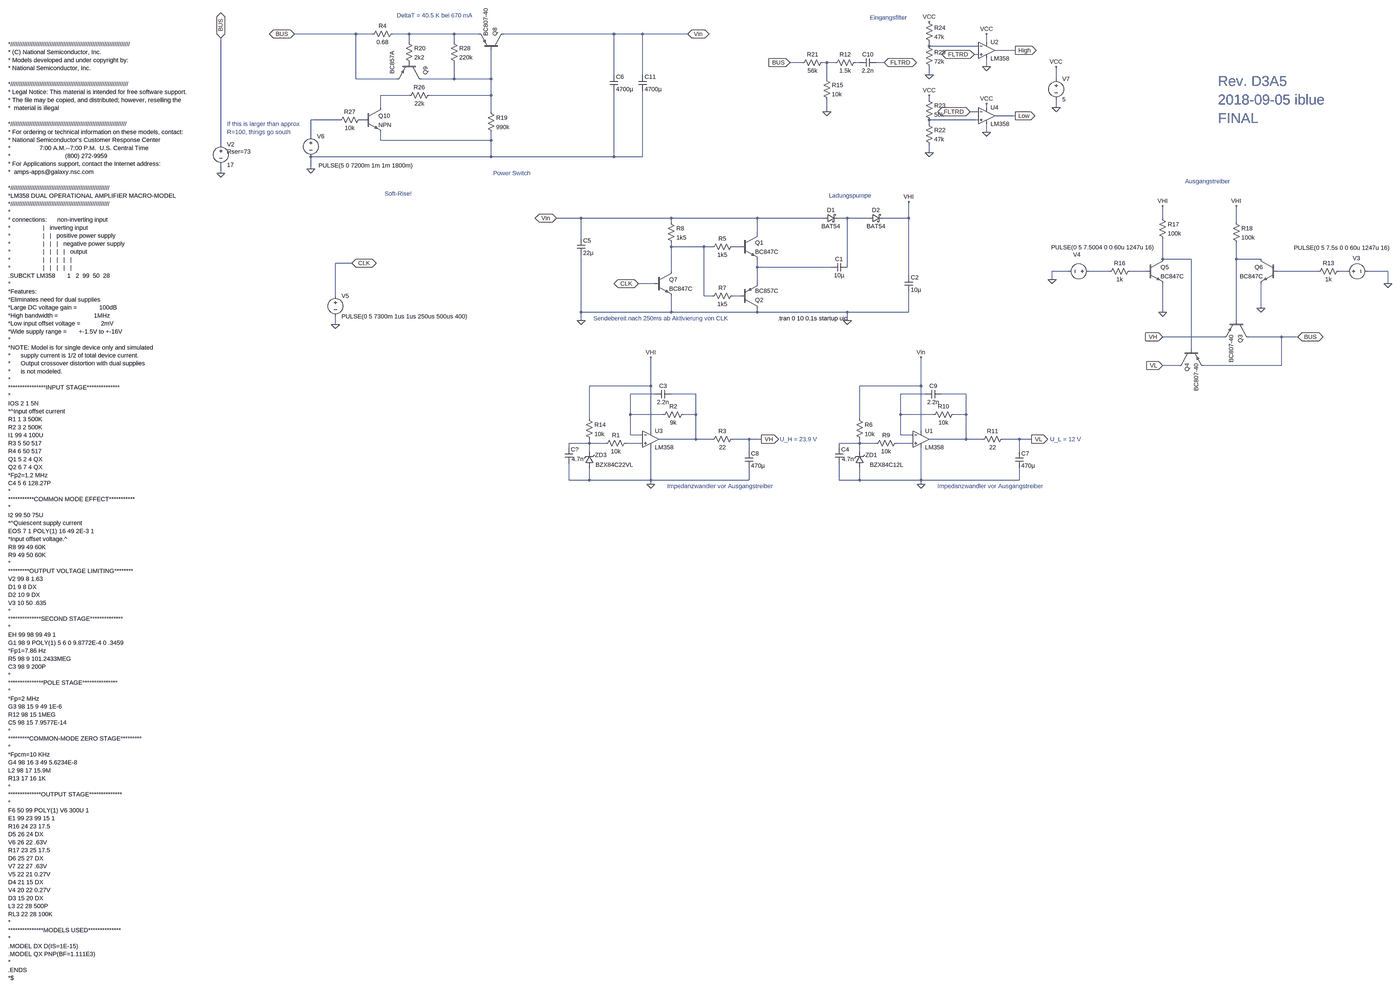
[diagram p0: schematic Final-E1A5-4.asc, whole sheet]
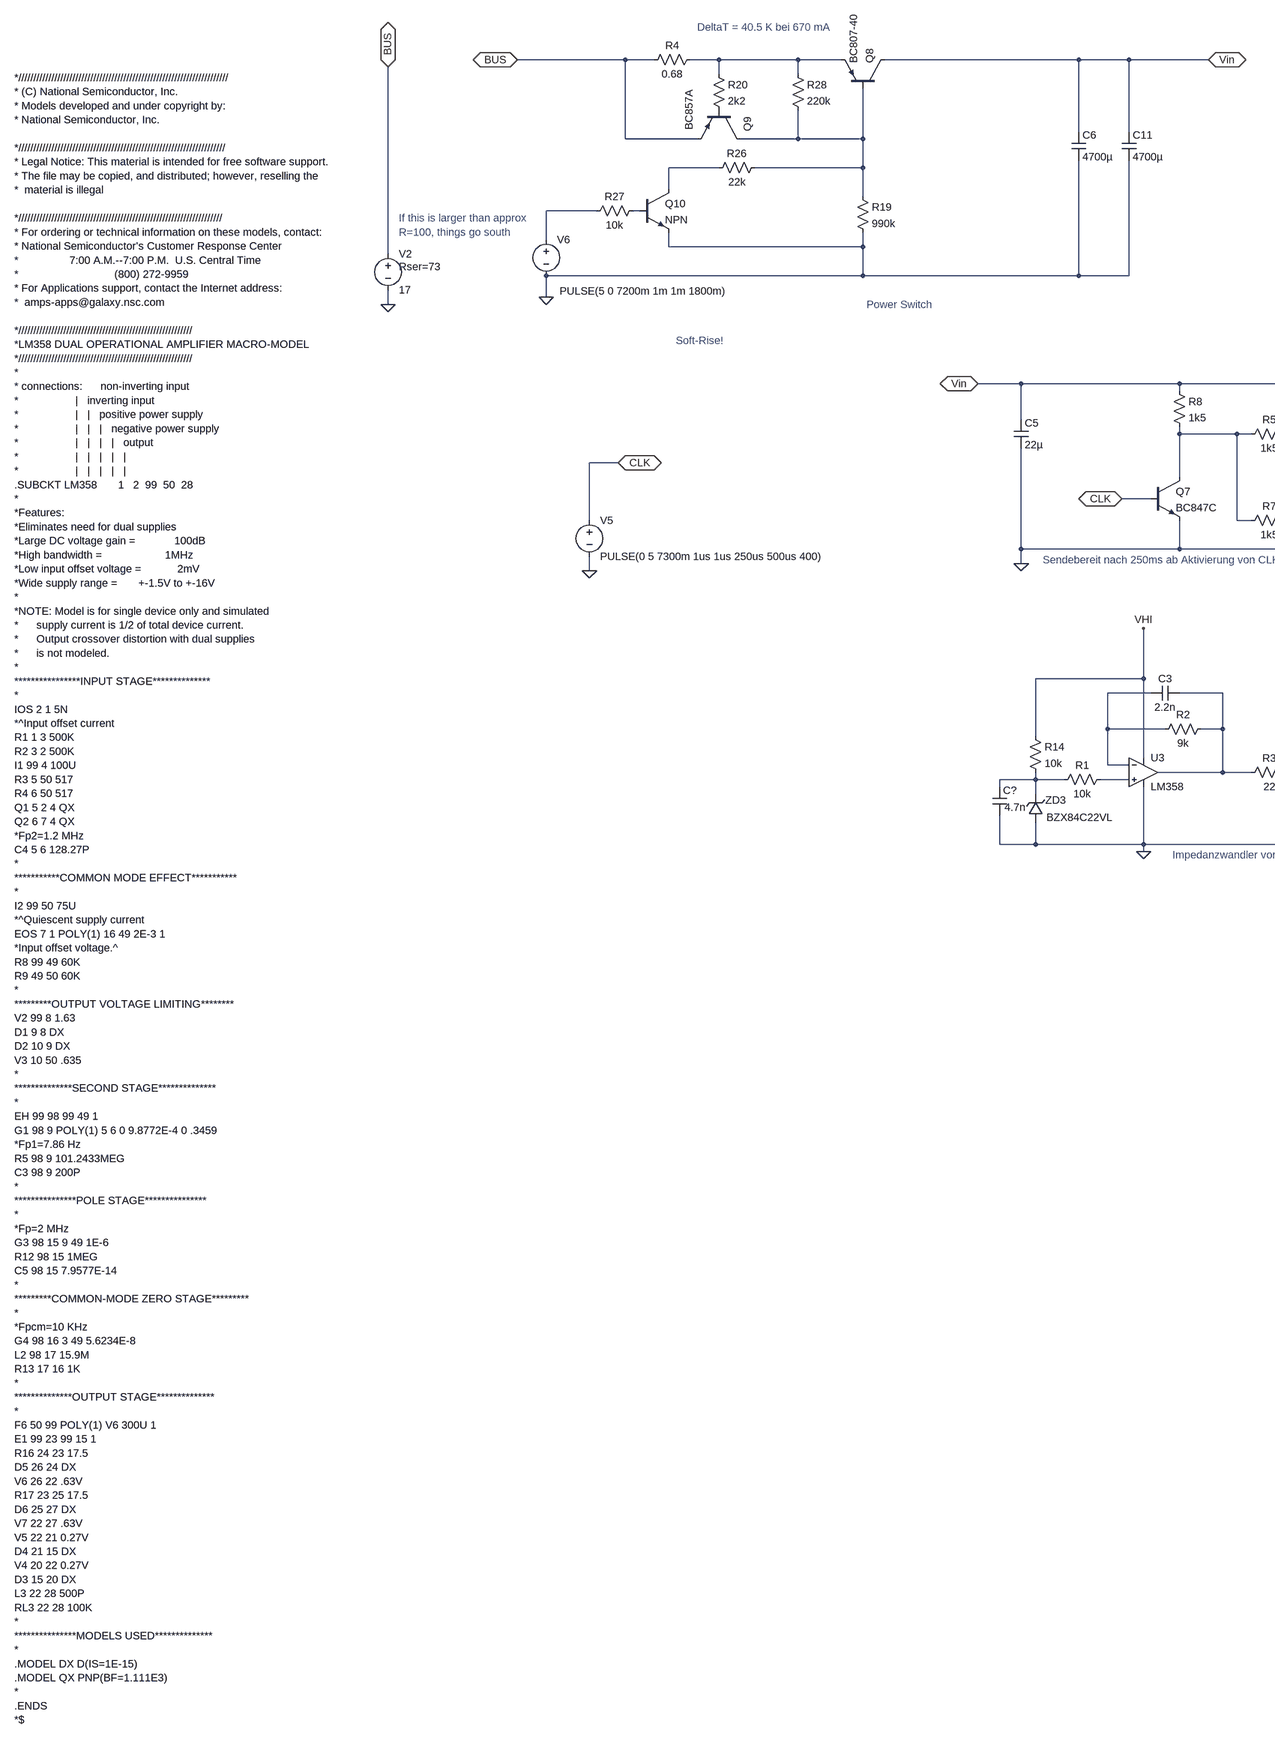
[diagram p1: schematic Final-E1A5-4.asc, part, row 1 of 1, column 1 of 2]
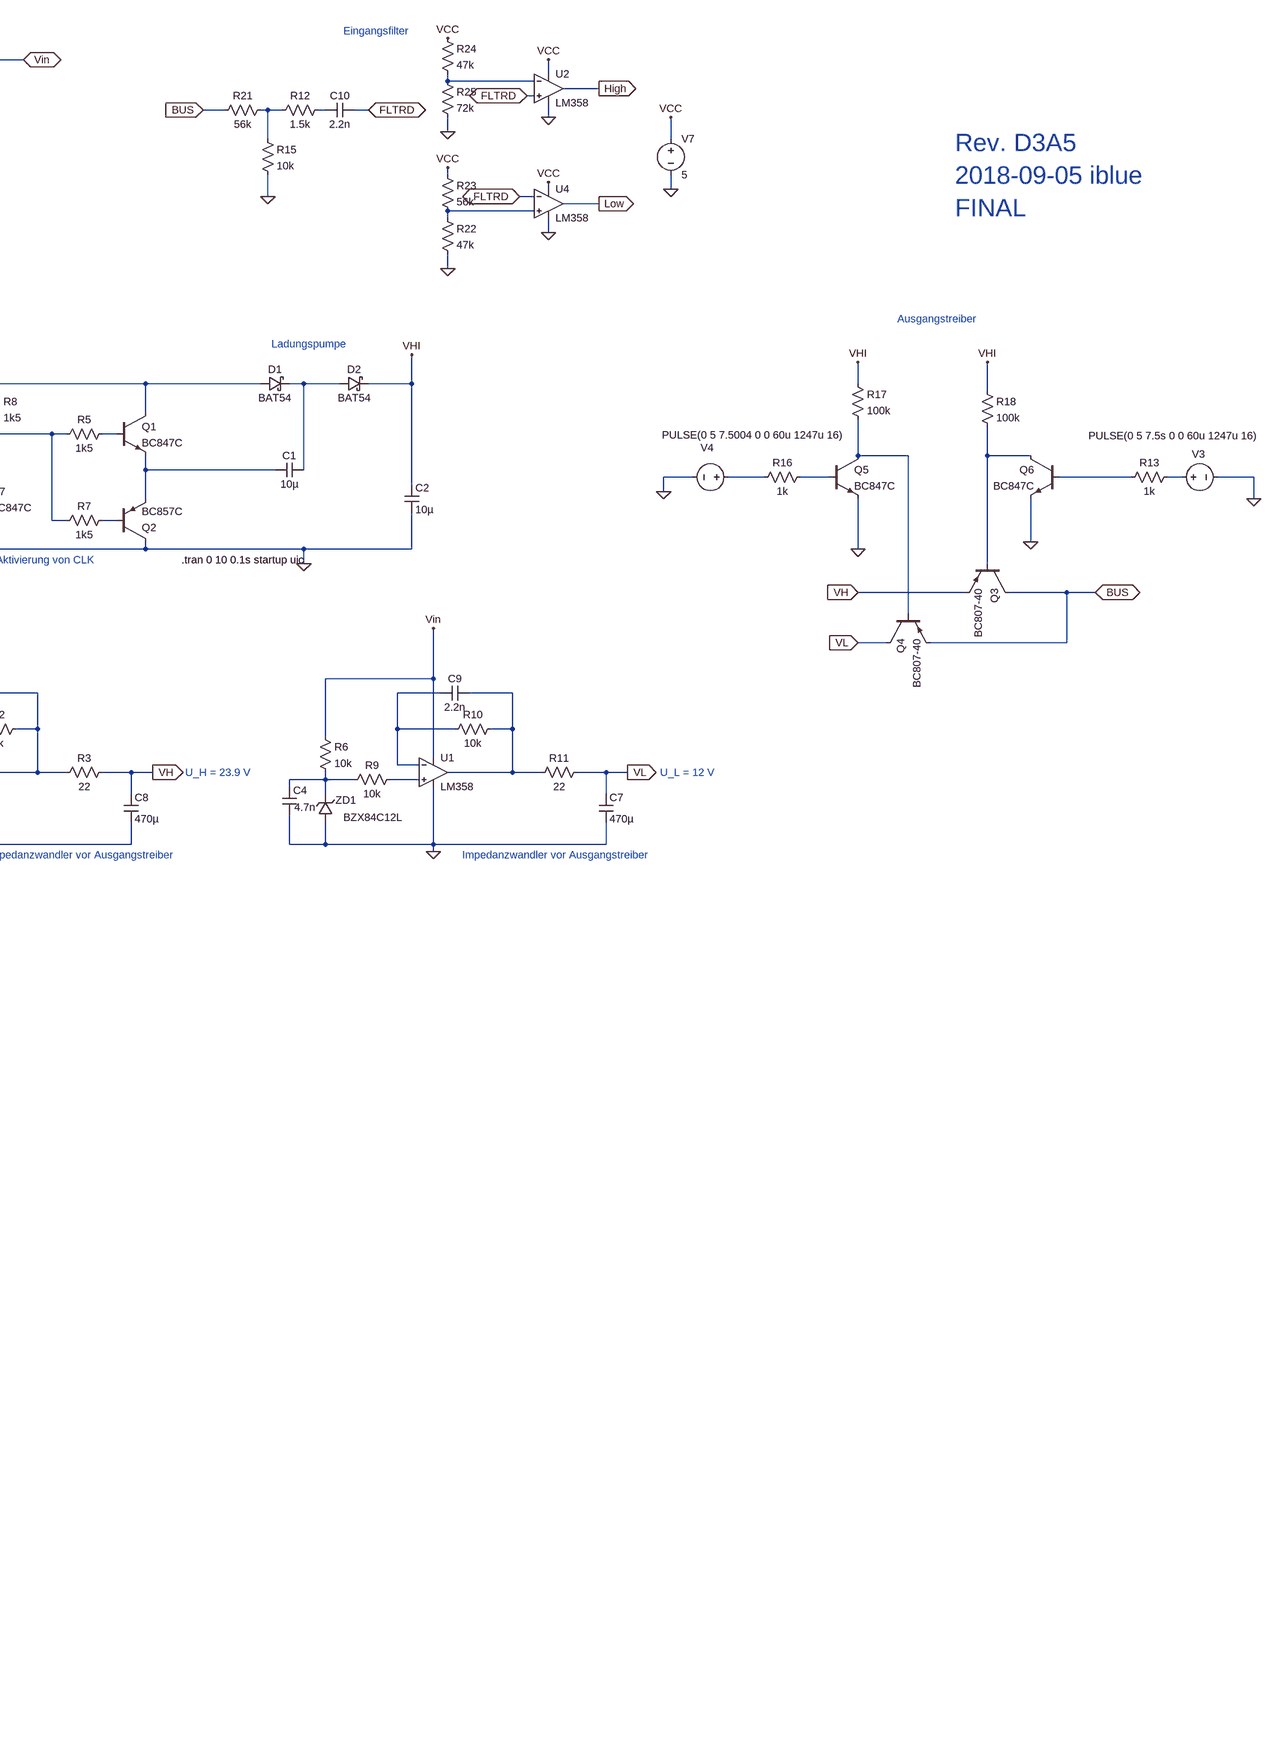
[diagram p2: schematic Final-E1A5-4.asc, part, row 1 of 1, column 2 of 2]
Final-E1A5-4.asc, the LTspice schematic file:
Version 4
SHEET 1 2516 2612
WIRE -1648 -800 -1888 -800
WIRE -1584 -800 -1648 -800
WIRE -1440 -800 -1504 -800
WIRE -1264 -800 -1440 -800
WIRE -1168 -800 -1264 -800
WIRE -640 -800 -1072 -800
WIRE -528 -800 -640 -800
WIRE -352 -800 -528 -800
WIRE -1440 -768 -1440 -800
WIRE -1264 -768 -1264 -800
WIRE 816 -768 816 -800
WIRE 592 -752 592 -768
WIRE 784 -752 592 -752
WIRE 928 -736 848 -736
WIRE 784 -720 768 -720
WIRE 96 -688 48 -688
WIRE 192 -688 176 -688
WIRE 224 -688 192 -688
WIRE 320 -688 304 -688
WIRE 416 -688 384 -688
WIRE 816 -672 816 -704
WIRE -640 -640 -640 -800
WIRE -528 -640 -528 -800
WIRE 592 -640 592 -672
WIRE -1648 -624 -1648 -800
WIRE -1488 -624 -1648 -624
WIRE -1264 -624 -1264 -688
WIRE -1264 -624 -1392 -624
WIRE -1120 -624 -1120 -736
WIRE -1120 -624 -1264 -624
WIRE 192 -624 192 -688
WIRE 1088 -624 1088 -672
WIRE -1440 -560 -1552 -560
WIRE -1120 -560 -1120 -624
WIRE -1120 -560 -1360 -560
WIRE 592 -544 592 -560
WIRE -1552 -512 -1552 -560
WIRE 816 -512 816 -528
WIRE 1088 -512 1088 -544
WIRE -1120 -496 -1120 -560
WIRE 192 -496 192 -544
WIRE 784 -496 752 -496
WIRE 928 -480 848 -480
WIRE -1712 -464 -1824 -464
WIRE -1616 -464 -1632 -464
WIRE 784 -464 592 -464
WIRE 592 -448 592 -464
WIRE 816 -416 816 -448
WIRE -1824 -400 -1824 -464
WIRE -1552 -384 -1552 -416
WIRE -1120 -384 -1120 -416
WIRE -1120 -384 -1552 -384
WIRE -2176 -368 -2176 -784
WIRE 592 -336 592 -368
WIRE -1120 -320 -1120 -384
WIRE -1120 -320 -1824 -320
WIRE -640 -320 -640 -576
WIRE -640 -320 -1120 -320
WIRE -528 -320 -528 -576
WIRE -528 -320 -640 -320
WIRE -1824 -272 -1824 -320
WIRE -2176 -256 -2176 -288
WIRE -768 -80 -864 -80
WIRE -416 -80 -768 -80
WIRE -80 -80 -416 -80
WIRE 176 -80 -80 -80
WIRE 272 -80 240 -80
WIRE 352 -80 272 -80
WIRE 512 -80 512 -144
WIRE 512 -80 416 -80
WIRE 1504 -80 1504 -128
WIRE -416 -64 -416 -80
WIRE 1792 -64 1792 -128
WIRE -80 -16 -80 -80
WIRE -768 0 -768 -80
WIRE -416 32 -416 16
WIRE -288 32 -416 32
WIRE -256 32 -288 32
WIRE -144 32 -176 32
WIRE 1504 80 1504 0
WIRE 1616 80 1504 80
WIRE 1792 80 1792 16
WIRE 1888 80 1792 80
WIRE -1664 96 -1728 96
WIRE -80 112 -80 80
WIRE 208 112 -80 112
WIRE 272 112 272 -80
WIRE -416 128 -416 32
WIRE 1136 128 1072 128
WIRE 1296 128 1216 128
WIRE 1440 128 1376 128
WIRE 2112 128 1952 128
WIRE 2224 128 2192 128
WIRE 2384 128 2304 128
WIRE 512 144 512 -80
WIRE 1072 160 1072 128
WIRE -480 176 -544 176
WIRE -80 176 -80 112
WIRE 2384 176 2384 128
WIRE -1728 224 -1728 96
WIRE -288 224 -288 32
WIRE -256 224 -288 224
WIRE -144 224 -176 224
WIRE 1888 272 1888 176
WIRE -768 288 -768 64
WIRE -416 288 -416 224
WIRE -416 288 -768 288
WIRE -80 288 -80 272
WIRE -80 288 -416 288
WIRE 272 288 -80 288
WIRE 512 288 512 208
WIRE 512 288 272 288
WIRE 1504 288 1504 176
WIRE -768 320 -768 288
WIRE 272 320 272 288
WIRE 1792 320 1792 80
WIRE -1728 336 -1728 304
WIRE 1744 384 1504 384
WIRE 1968 384 1840 384
WIRE 2032 384 1968 384
WIRE 1616 432 1616 80
WIRE 1568 496 1504 496
WIRE 1968 496 1968 384
WIRE 1968 496 1664 496
WIRE -496 576 -496 464
WIRE -496 576 -736 576
WIRE 560 576 560 464
WIRE 560 576 320 576
WIRE -480 608 -576 608
WIRE -320 608 -416 608
WIRE 576 608 480 608
WIRE 736 608 640 608
WIRE -576 688 -576 608
WIRE -448 688 -576 688
WIRE -320 688 -320 608
WIRE -320 688 -368 688
WIRE 480 688 480 608
WIRE 608 688 480 688
WIRE 736 688 736 608
WIRE 736 688 688 688
WIRE -736 704 -736 576
WIRE 320 704 320 576
WIRE -496 752 -496 576
WIRE 560 752 560 576
WIRE -576 768 -576 688
WIRE -528 768 -576 768
WIRE 480 768 480 688
WIRE 528 768 480 768
WIRE -320 784 -320 688
WIRE -320 784 -464 784
WIRE -256 784 -320 784
WIRE -112 784 -176 784
WIRE -64 784 -112 784
WIRE 736 784 736 688
WIRE 736 784 592 784
WIRE 800 784 736 784
WIRE 944 784 880 784
WIRE 992 784 944 784
WIRE -736 800 -736 784
WIRE -736 800 -816 800
WIRE -672 800 -736 800
WIRE -528 800 -592 800
WIRE 320 800 320 784
WIRE 320 800 240 800
WIRE 384 800 320 800
WIRE 528 800 464 800
WIRE -816 816 -816 800
WIRE 240 816 240 800
WIRE -736 832 -736 800
WIRE -112 832 -112 784
WIRE 320 832 320 800
WIRE 944 832 944 784
WIRE -816 944 -816 880
WIRE -736 944 -736 896
WIRE -736 944 -816 944
WIRE -496 944 -496 816
WIRE -496 944 -736 944
WIRE -112 944 -112 896
WIRE -112 944 -496 944
WIRE 240 944 240 880
WIRE 320 944 320 896
WIRE 320 944 240 944
WIRE 560 944 560 816
WIRE 560 944 320 944
WIRE 944 944 944 896
WIRE 944 944 560 944
WIRE -496 960 -496 944
WIRE 560 960 560 944
FLAG 272 320 0
FLAG -544 176 CLK
IOPIN -544 176 BiDir
FLAG 512 -144 VHI
FLAG -64 784 VH
IOPIN -64 784 Out
FLAG -496 464 VHI
FLAG -496 960 0
FLAG 992 784 VL
IOPIN 992 784 Out
FLAG 560 960 0
FLAG 2384 176 0
FLAG 1504 496 VL
IOPIN 1504 496 In
FLAG 1504 384 VH
IOPIN 1504 384 In
FLAG 1504 -128 VHI
FLAG 1072 160 0
FLAG 1504 288 0
FLAG 1792 -128 VHI
FLAG 1888 272 0
FLAG -1728 336 0
FLAG -1664 96 CLK
IOPIN -1664 96 BiDir
FLAG -2176 -256 0
FLAG -2176 -784 BUS
IOPIN -2176 -784 BiDir
FLAG -1824 -272 0
FLAG -352 -800 Vin
IOPIN -352 -800 BiDir
FLAG -864 -80 Vin
IOPIN -864 -80 BiDir
FLAG -768 320 0
FLAG -1888 -800 BUS
IOPIN -1888 -800 BiDir
FLAG 2032 384 BUS
IOPIN 2032 384 BiDir
FLAG 48 -688 BUS
IOPIN 48 -688 In
FLAG 928 -480 Low
IOPIN 928 -480 Out
FLAG 928 -736 High
IOPIN 928 -736 Out
FLAG 192 -496 0
FLAG 816 -672 0
FLAG 816 -416 0
FLAG 592 -640 0
FLAG 592 -336 0
FLAG 1088 -512 0
FLAG 1088 -672 VCC
FLAG 816 -800 VCC
FLAG 816 -528 VCC
FLAG 592 -848 VCC
FLAG 416 -688 FLTRD
IOPIN 416 -688 BiDir
FLAG 768 -720 FLTRD
IOPIN 768 -720 BiDir
FLAG 592 -560 VCC
FLAG 752 -496 FLTRD
IOPIN 752 -496 BiDir
FLAG 560 464 Vin
SYMBOL schottky 176 -64 R270
WINDOW 0 32 32 VTop 2
WINDOW 3 0 32 VBottom 2
SYMATTR InstName D1
SYMATTR Value BAT54
SYMATTR Description Diode
SYMATTR Type diode
SYMBOL schottky 352 -64 R270
WINDOW 0 32 32 VTop 2
WINDOW 3 0 32 VBottom 2
SYMATTR InstName D2
SYMATTR Value BAT54
SYMATTR Description Diode
SYMATTR Type diode
SYMBOL cap 272 96 R90
WINDOW 0 0 32 VBottom 2
WINDOW 3 32 32 VTop 2
SYMATTR InstName C1
SYMATTR Value 10µ
SYMBOL cap 496 144 R0
SYMATTR InstName C2
SYMATTR Value 10µ
SYMBOL Opamps\\opamp2 -496 720 R0
SYMATTR InstName U3
SYMATTR Value LM358
SYMATTR SpiceModel LM358
SYMBOL res -752 688 R0
SYMATTR InstName R14
SYMATTR Value 10k
SYMBOL cap -832 816 R0
WINDOW 3 27 46 Left 2
SYMATTR Value 4.7n
SYMATTR InstName C?
SYMBOL res -576 784 R90
WINDOW 0 0 56 VBottom 2
WINDOW 3 32 56 VTop 2
SYMATTR InstName R1
SYMATTR Value 10k
SYMBOL res -352 672 R90
WINDOW 0 0 56 VBottom 2
WINDOW 3 32 56 VTop 2
SYMATTR InstName R2
SYMATTR Value 9k
SYMBOL cap -128 832 R0
SYMATTR InstName C8
SYMATTR Value 470µ
SYMBOL res -160 768 R90
WINDOW 0 0 56 VBottom 2
WINDOW 3 32 56 VTop 2
SYMATTR InstName R3
SYMATTR Value 22
SYMBOL cap -416 592 R90
WINDOW 0 0 32 VBottom 2
WINDOW 3 32 32 VTop 2
SYMATTR InstName C3
SYMATTR Value 2.2n
SYMBOL zener -720 896 R180
WINDOW 0 -52 50 Left 2
WINDOW 3 -155 12 Left 2
SYMATTR InstName ZD3
SYMATTR Value BZX84C22VL
SYMBOL Opamps\\opamp2 560 720 R0
SYMATTR InstName U1
SYMATTR Value LM358
SYMATTR SpiceModel LM358
SYMBOL res 304 688 R0
SYMATTR InstName R6
SYMATTR Value 10k
SYMBOL cap 224 816 R0
WINDOW 3 27 46 Left 2
SYMATTR Value 4.7n
SYMATTR InstName C4
SYMBOL res 480 784 R90
WINDOW 0 0 56 VBottom 2
WINDOW 3 32 56 VTop 2
SYMATTR InstName R9
SYMATTR Value 10k
SYMBOL res 704 672 R90
WINDOW 0 0 56 VBottom 2
WINDOW 3 32 56 VTop 2
SYMATTR InstName R10
SYMATTR Value 10k
SYMBOL cap 928 832 R0
SYMATTR InstName C7
SYMATTR Value 470µ
SYMBOL res 896 768 R90
WINDOW 0 0 56 VBottom 2
WINDOW 3 32 56 VTop 2
SYMATTR InstName R11
SYMATTR Value 22
SYMBOL cap 640 592 R90
WINDOW 0 0 32 VBottom 2
WINDOW 3 32 32 VTop 2
SYMATTR InstName C9
SYMATTR Value 2.2n
SYMBOL zener 336 896 R180
WINDOW 0 -52 50 Left 2
WINDOW 3 -155 12 Left 2
SYMATTR InstName ZD1
SYMATTR Value BZX84C12L
SYMBOL voltage 2208 128 M90
WINDOW 0 -51 68 VLeft 2
WINDOW 3 -92 185 VLeft 2
WINDOW 123 0 0 Left 0
WINDOW 39 0 0 Left 0
SYMATTR InstName V3
SYMATTR Value PULSE(0 5 7.5s 0 0 60u 1247u 16)
SYMBOL res 2208 112 R90
WINDOW 0 0 56 VBottom 2
WINDOW 3 32 56 VTop 2
SYMATTR InstName R13
SYMATTR Value 1k
SYMBOL voltage 1232 128 M270
WINDOW 0 65 78 VLeft 2
WINDOW 3 94 164 VLeft 2
WINDOW 123 0 0 Left 0
WINDOW 39 0 0 Left 0
SYMATTR InstName V4
SYMATTR Value PULSE(0 5 7.5004 0 0 60u 1247u 16)
SYMBOL npn 1440 80 R0
SYMATTR InstName Q5
SYMATTR Value BC847C
SYMBOL res 1392 112 R90
WINDOW 0 0 56 VBottom 2
WINDOW 3 32 56 VTop 2
SYMATTR InstName R16
SYMATTR Value 1k
SYMBOL res 1488 -96 R0
SYMATTR InstName R17
SYMATTR Value 100k
SYMBOL npn 1952 80 M0
SYMATTR InstName Q6
SYMATTR Value BC847C
SYMBOL res 1776 -80 R0
SYMATTR InstName R18
SYMATTR Value 100k
SYMBOL npn -144 -16 R0
SYMATTR InstName Q1
SYMATTR Value BC847C
SYMBOL pnp -144 272 M180
SYMATTR InstName Q2
SYMATTR Value BC857C
SYMBOL npn -480 128 R0
SYMATTR InstName Q7
SYMATTR Value BC847C
SYMBOL res -160 16 R90
WINDOW 0 0 56 VBottom 2
WINDOW 3 32 56 VTop 2
SYMATTR InstName R5
SYMATTR Value 1k5
SYMBOL res -160 208 R90
WINDOW 0 0 56 VBottom 2
WINDOW 3 32 56 VTop 2
SYMATTR InstName R7
SYMATTR Value 1k5
SYMBOL res -432 -80 R0
SYMATTR InstName R8
SYMATTR Value 1k5
SYMBOL voltage -1728 208 R0
WINDOW 123 0 0 Left 0
WINDOW 39 0 0 Left 0
SYMATTR InstName V5
SYMATTR Value PULSE(0 5 7300m 1us 1us 250us 500us 400)
SYMBOL cap -784 0 R0
SYMATTR InstName C5
SYMATTR Value 22µ
SYMBOL voltage -2176 -384 R0
WINDOW 123 0 0 Left 0
WINDOW 39 24 44 Left 2
SYMATTR SpiceLine Rser=73
SYMATTR InstName V2
SYMATTR Value 17
SYMBOL pnp -1072 -736 M270
SYMATTR InstName Q8
SYMATTR Value BC807-40
SYMBOL voltage -1824 -416 R0
WINDOW 3 30 130 Left 2
WINDOW 123 0 0 Left 0
WINDOW 39 0 0 Left 0
SYMATTR InstName V6
SYMATTR Value PULSE(5 0 7200m 1m 1m 1800m)
SYMBOL cap -656 -640 R0
SYMATTR InstName C6
SYMATTR Value 4700µ
SYMBOL pnp 1840 320 R90
SYMATTR InstName Q3
SYMATTR Value BC807-40
SYMBOL pnp 1568 432 M90
SYMATTR InstName Q4
SYMATTR Value BC807-40
SYMBOL res 320 -704 R90
WINDOW 0 0 56 VBottom 2
WINDOW 3 32 56 VTop 2
SYMATTR InstName R12
SYMATTR Value 1.5k
SYMATTR SpiceLine tol=5
SYMBOL res 176 -640 R0
SYMATTR InstName R15
SYMATTR Value 10k
SYMBOL res 192 -704 R90
WINDOW 0 0 56 VBottom 2
WINDOW 3 32 56 VTop 2
SYMATTR InstName R21
SYMATTR Value 56k
SYMBOL voltage 1088 -640 R0
WINDOW 123 0 0 Left 0
WINDOW 39 0 0 Left 0
SYMATTR InstName V7
SYMATTR Value 5
SYMBOL res 576 -464 R0
SYMATTR InstName R22
SYMATTR Value 47k
SYMBOL res 576 -560 R0
SYMATTR InstName R23
SYMATTR Value 56k
SYMBOL res 576 -864 R0
SYMATTR InstName R24
SYMATTR Value 47k
SYMBOL res 576 -768 R0
SYMATTR InstName R25
SYMATTR Value 72k
SYMBOL Opamps\\opamp2 816 -800 R0
SYMATTR InstName U2
SYMATTR Value LM358
SYMBOL Opamps\\opamp2 816 -544 R0
SYMATTR InstName U4
SYMATTR Value LM358
SYMBOL cap 384 -704 R90
WINDOW 0 0 32 VBottom 2
WINDOW 3 32 32 VTop 2
SYMATTR InstName C10
SYMATTR Value 2.2n
SYMBOL res -1488 -816 R90
WINDOW 0 0 56 VBottom 2
WINDOW 3 32 56 VTop 2
SYMATTR InstName R4
SYMATTR Value 0.68
SYMBOL pnp -1392 -688 R90
WINDOW 0 16 -16 Left 2
WINDOW 3 -45 114 Left 2
SYMATTR InstName Q9
SYMATTR Value BC857A
SYMBOL res -1136 -512 R0
SYMATTR InstName R19
SYMATTR Value 990k
SYMBOL res -1456 -784 R0
SYMATTR InstName R20
SYMATTR Value 2k2
SYMBOL npn -1616 -512 R0
SYMATTR InstName Q10
SYMBOL res -1344 -576 R90
WINDOW 0 0 56 VBottom 2
WINDOW 3 32 56 VTop 2
SYMATTR InstName R26
SYMATTR Value 22k
SYMBOL res -1616 -480 R90
WINDOW 0 0 56 VBottom 2
WINDOW 3 32 56 VTop 2
SYMATTR InstName R27
SYMATTR Value 10k
SYMBOL cap -544 -640 R0
SYMATTR InstName C11
SYMATTR Value 4700µ
SYMBOL res -1280 -784 R0
SYMATTR InstName R28
SYMATTR Value 220k
TEXT 0 312 Left 2 !.tran 0 10 0.1s startup uic
TEXT 200 -168 Left 2 ;Ladungspumpe
TEXT -3640 -760 Left 2 !*//////////////////////////////////////////////////////////////////////\n* (C) National Semiconductor, Inc.\n* Models developed and under copyright by:\n* National Semiconductor, Inc.  \n \n*/////////////////////////////////////////////////////////////////////\n* Legal Notice: This material is intended for free software support.\n* The file may be copied, and distributed; however, reselling the \n*  material is illegal\n \n*////////////////////////////////////////////////////////////////////\n* For ordering or technical information on these models, contact:\n* National Semiconductor's Customer Response Center\n*                 7:00 A.M.--7:00 P.M.  U.S. Central Time\n*                                (800) 272-9959\n* For Applications support, contact the Internet address:\n*  amps-apps@galaxy.nsc.com\n \n*//////////////////////////////////////////////////////////\n*LM358 DUAL OPERATIONAL AMPLIFIER MACRO-MODEL\n*//////////////////////////////////////////////////////////\n*\n* connections:      non-inverting input\n*                   |   inverting input\n*                   |   |   positive power supply\n*                   |   |   |   negative power supply\n*                   |   |   |   |   output\n*                   |   |   |   |   |\n*                   |   |   |   |   |\n.SUBCKT LM358       1   2  99  50  28\n*\n*Features:\n*Eliminates need for dual supplies\n*Large DC voltage gain =             100dB\n*High bandwidth =                     1MHz\n*Low input offset voltage =            2mV\n*Wide supply range =       +-1.5V to +-16V\n*\n*NOTE: Model is for single device only and simulated\n*      supply current is 1/2 of total device current.\n*      Output crossover distortion with dual supplies\n*      is not modeled.\n*\n****************INPUT STAGE**************\n*\nIOS 2 1 5N\n*^Input offset current\nR1 1 3 500K\nR2 3 2 500K\nI1 99 4 100U\nR3 5 50 517\nR4 6 50 517\nQ1 5 2 4 QX\nQ2 6 7 4 QX\n*Fp2=1.2 MHz\nC4 5 6 128.27P\n*\n***********COMMON MODE EFFECT***********\n*\nI2 99 50 75U\n*^Quiescent supply current\nEOS 7 1 POLY(1) 16 49 2E-3 1\n*Input offset voltage.^\nR8 99 49 60K\nR9 49 50 60K\n*\n*********OUTPUT VOLTAGE LIMITING********\nV2 99 8 1.63\nD1 9 8 DX\nD2 10 9 DX\nV3 10 50 .635\n*\n**************SECOND STAGE**************\n*\nEH 99 98 99 49 1\nG1 98 9 POLY(1) 5 6 0 9.8772E-4 0 .3459\n*Fp1=7.86 Hz\nR5 98 9 101.2433MEG\nC3 98 9 200P\n*\n***************POLE STAGE***************\n*\n*Fp=2 MHz\nG3 98 15 9 49 1E-6\nR12 98 15 1MEG\nC5 98 15 7.9577E-14\n*\n*********COMMON-MODE ZERO STAGE*********\n*\n*Fpcm=10 KHz\nG4 98 16 3 49 5.6234E-8               \nL2 98 17 15.9M\nR13 17 16 1K\n*\n**************OUTPUT STAGE**************\n*\nF6 50 99 POLY(1) V6 300U 1\nE1 99 23 99 15 1\nR16 24 23 17.5\nD5 26 24 DX\nV6 26 22 .63V\nR17 23 25 17.5\nD6 25 27 DX\nV7 22 27 .63V\nV5 22 21 0.27V\nD4 21 15 DX\nV4 20 22 0.27V\nD3 15 20 DX\nL3 22 28 500P\nRL3 22 28 100K\n*\n***************MODELS USED**************\n*\n.MODEL DX D(IS=1E-15)\n.MODEL QX PNP(BF=1.111E3)\n*\n.ENDS\n*$
TEXT 8 784 Left 2 ;U_H = 23.9 V
TEXT -432 968 Left 2 ;Impedanzwandler vor Ausgangstreiber
TEXT 1064 784 Left 2 ;U_L = 12 V
TEXT 624 968 Left 2 ;Impedanzwandler vor Ausgangstreiber
TEXT -720 312 Left 2 ;Sendebereit nach 250ms ab Aktivierung von CLK
TEXT -1488 -872 Left 2 ;DeltaT = 40.5 K bei 670 mA
TEXT -1112 -256 Left 2 ;Power Switch
TEXT 1720 -616 Left 5 ;Rev. D3A5\n2018-09-05 iblue\nFINAL
TEXT 1592 -224 Left 2 ;Ausgangstreiber
TEXT 360 -864 Left 2 ;Eingangsfilter
TEXT -1536 -176 Left 2 ;Soft-Rise!
TEXT -2152 -448 Left 2 ;If this is larger than approx\nR=100, things go south

The netlist it stands for:
* Final-E1A5-4.asc
D1 Vin N010 BAT54
D2 N010 VHI BAT54
C1 N010 N015 10µ
C2 VHI 0 10µ
XU3 N026 N021 VHI 0 N022 LM358 LM358  ; pins In+ In- V+ V- OUT
R14 VHI N025 10k
C? N025 0 4.7n
R1 N026 N025 10k
R2 N022 N021 9k
C8 VH 0 470µ
R3 VH N022 22
C3 N022 N021 2.2n
D§ZD3 0 N025 BZX84C22VL
XU1 N028 N023 Vin 0 N024 LM358 LM358  ; pins In+ In- V+ V- OUT
R6 Vin N027 10k
C4 N027 0 4.7n
R9 N028 N027 10k
R10 N024 N023 10k
C7 VL 0 470µ
R11 VL N024 22
C9 N024 N023 2.2n
D§ZD1 0 N027 BZX84C12L
V3 N019 0 PULSE(0 5 7.5s 0 0 60u 1247u 16)
R13 N019 N018 1k
V4 N016 0 PULSE(0 5 7.5004 0 0 60u 1247u 16)
Q5 N013 N017 0 0 BC847C
R16 N017 N016 1k
R17 VHI N013 100k
Q6 N014 N018 0 0 BC847C
R18 VHI N014 100k
Q1 Vin N012 N015 0 BC847C
Q2 0 N020 N015 0 BC857C
Q7 N011 CLK 0 0 BC847C
R5 N012 N011 1k5
R7 N020 N011 1k5
R8 Vin N011 1k5
V5 CLK 0 PULSE(0 5 7300m 1us 1us 250us 500us 400)
C5 Vin 0 22µ
V2 BUS 0 17 Rser=73
Q8 Vin N005 N001 0 BC807-40
V6 N007 0 PULSE(5 0 7200m 1m 1m 1800m)
C6 Vin 0 4700µ
Q3 BUS N014 VH 0 BC807-40
Q4 VL N013 BUS 0 BC807-40
R12 N004 N003 1.5k tol=5
R15 N003 0 10k
R21 N003 BUS 56k
V7 VCC 0 5
R22 N009 0 47k
R23 VCC N009 56k
R24 VCC N002 47k
R25 N002 0 72k
XU2 FLTRD N002 VCC 0 High LM358  ; pins In+ In- V+ V- OUT
XU4 N009 FLTRD VCC 0 Low LM358  ; pins In+ In- V+ V- OUT
C10 FLTRD N004 2.2n
R4 N001 BUS 0.68
Q9 N005 P001 BUS 0 BC857A
R19 N005 0 990k
R20 N001 P001 2k2
Q10 N006 N008 0 0 NPN
R26 N005 N006 22k
R27 N008 N007 10k
C11 Vin 0 4700µ
R28 N001 N005 220k
.model D D
.lib standard.dio
.model NPN NPN
.model PNP PNP
.lib standard.bjt
.tran 0 10 0.1s startup uic
* Ladungspumpe
*//////////////////////////////////////////////////////////////////////
* (C) National Semiconductor, Inc.
* Models developed and under copyright by:
* National Semiconductor, Inc.
*/////////////////////////////////////////////////////////////////////
* Legal Notice: This material is intended for free software support.
* The file may be copied, and distributed; however, reselling the
*  material is illegal
*////////////////////////////////////////////////////////////////////
* For ordering or technical information on these models, contact:
* National Semiconductor's Customer Response Center
*                 7:00 A.M.--7:00 P.M.  U.S. Central Time
*                                (800) 272-9959
* For Applications support, contact the Internet address:
*  amps-apps@galaxy.nsc.com
*//////////////////////////////////////////////////////////
*LM358 DUAL OPERATIONAL AMPLIFIER MACRO-MODEL
*//////////////////////////////////////////////////////////
*
* connections:      non-inverting input
*                   |   inverting input
*                   |   |   positive power supply
*                   |   |   |   negative power supply
*                   |   |   |   |   output
*                   |   |   |   |   |
*                   |   |   |   |   |
.SUBCKT LM358       1   2  99  50  28
*
*Features:
*Eliminates need for dual supplies
*Large DC voltage gain =             100dB
*High bandwidth =                     1MHz
*Low input offset voltage =            2mV
*Wide supply range =       +-1.5V to +-16V
*
*NOTE: Model is for single device only and simulated
*      supply current is 1/2 of total device current.
*      Output crossover distortion with dual supplies
*      is not modeled.
*
****************INPUT STAGE**************
*
IOS 2 1 5N
*^Input offset current
R1 1 3 500K
R2 3 2 500K
I1 99 4 100U
R3 5 50 517
R4 6 50 517
Q1 5 2 4 QX
Q2 6 7 4 QX
*Fp2=1.2 MHz
C4 5 6 128.27P
*
***********COMMON MODE EFFECT***********
*
I2 99 50 75U
*^Quiescent supply current
EOS 7 1 POLY(1) 16 49 2E-3 1
*Input offset voltage.^
R8 99 49 60K
R9 49 50 60K
*
*********OUTPUT VOLTAGE LIMITING********
V2 99 8 1.63
D1 9 8 DX
D2 10 9 DX
V3 10 50 .635
*
**************SECOND STAGE**************
*
EH 99 98 99 49 1
G1 98 9 POLY(1) 5 6 0 9.8772E-4 0 .3459
*Fp1=7.86 Hz
R5 98 9 101.2433MEG
C3 98 9 200P
*
***************POLE STAGE***************
*
*Fp=2 MHz
G3 98 15 9 49 1E-6
R12 98 15 1MEG
C5 98 15 7.9577E-14
*
*********COMMON-MODE ZERO STAGE*********
*
*Fpcm=10 KHz
G4 98 16 3 49 5.6234E-8
L2 98 17 15.9M
R13 17 16 1K
*
**************OUTPUT STAGE**************
*
F6 50 99 POLY(1) V6 300U 1
E1 99 23 99 15 1
R16 24 23 17.5
D5 26 24 DX
V6 26 22 .63V
R17 23 25 17.5
D6 25 27 DX
V7 22 27 .63V
V5 22 21 0.27V
D4 21 15 DX
V4 20 22 0.27V
D3 15 20 DX
L3 22 28 500P
RL3 22 28 100K
*
***************MODELS USED**************
*
.MODEL DX D(IS=1E-15)
.MODEL QX PNP(BF=1.111E3)
*
.ENDS
*$
* U_H = 23.9 V
* Impedanzwandler vor Ausgangstreiber
* U_L = 12 V
* Impedanzwandler vor Ausgangstreiber
* Sendebereit nach 250ms ab Aktivierung von CLK
* DeltaT = 40.5 K bei 670 mA
* Power Switch
* Rev. D3A5
* 2018-09-05 iblue
* FINAL
* Ausgangstreiber
* Eingangsfilter
* Soft-Rise!
* If this is larger than approx
* R=100, things go south
.backanno
.end